# Altium project SISPS-BATT-INT-PCB.PrjPcb (part 1 of 2)
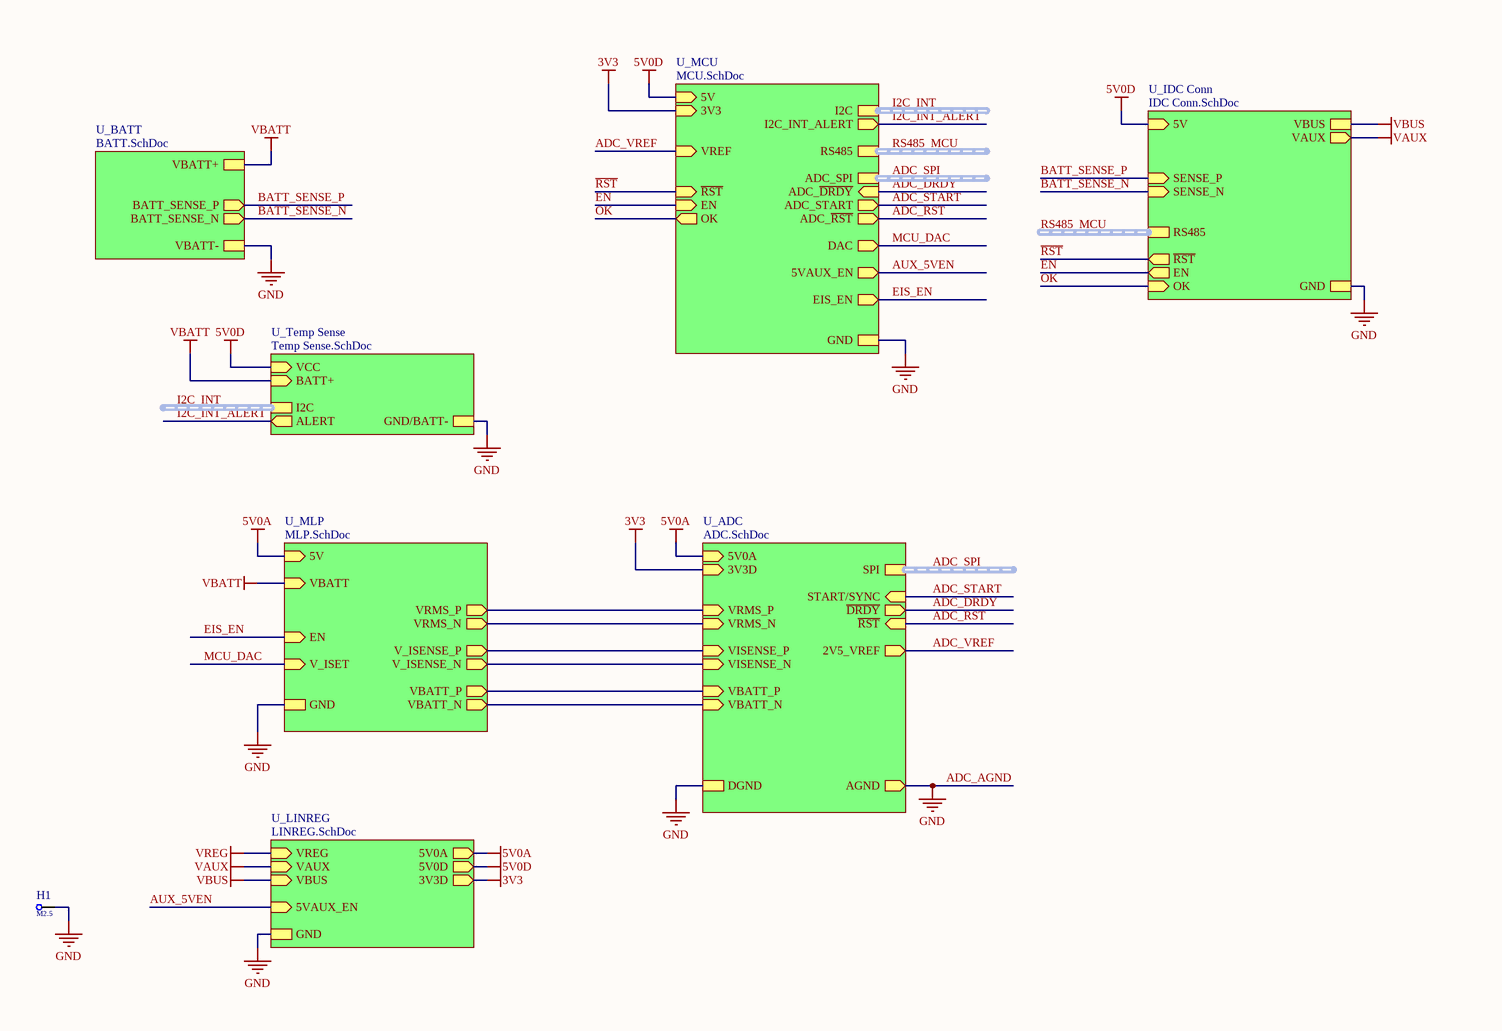
[diagram p0: Main.SchDoc, left]
Approv_Date_Chk: 16/01/2026; Approv_Date_Eng: 24/01/2026; ASM_DOC: Assembley.PCBDwf; BOM_DOC: Bill of Materials.csv; Checker: JC Pead; CopyrightHolder: LD Stanton; CopyrightYear: 2026; CPL_DOC: Pick and Place.csv; DwgTitleLine1: SISPS-BATT-INT-PCB; DwgTitleLine2: Battery Unit Interposer; FAB_DOC: Fabrication.PCBDwf; Licence: CERN OHL v2 S; PCB_DOC: PCB.PcbDoc; Project_Revision: v0.2.1; Rev_Date_1: 30/09/2025; Rev_Date_2: 12/12/2025; Rev_Date_3: 24/01/2026; Rev_Date_4: --/--/----; Rev_Desc_1: EIS Circuitry Prototype; Rev_Desc_2: Faulty Release; Rev_Desc_3: Impedance Measurement Corrections; Rev_Desc_4: - - - - -; Rev_No_1: v0.1; Rev_No_2: v0.2; Rev_No_3: v0.2.1; Rev_No_4: -; SCH_DOC: Main.SchDoc
14 sheets, 192 parts. Net scope: strictly hierarchical (ports join the sheet entries above them; power ports are local).
Board file: PCB.PcbDoc
Sheets:
  Main.SchDoc
    U_Temp Sense = Temp Sense.SchDoc
    U_MCU = MCU.SchDoc
      U_SWD = SWD.SchDoc
      U_RS485 = RS485.SchDoc
    U_IDC Conn = IDC Conn.SchDoc
    U_MLP = MLP.SchDoc
      U_RMS = RMS.SchDoc
      U_EL = EL.SchDoc
      U_VBATT Sense = VBATT Sense.SchDoc
    U_ADC = ADC.SchDoc
      U_ADC AIN = ADC AIN.SchDoc
    U_LINREG = LINREG.SchDoc
    U_BATT = BATT.SchDoc

## Sheet Main.SchDoc: Main Schematic
size A4; ApprovedBy: LD Stanton; Author: LD Stanton; DrawnBy: LD Stanton; Engineer: LD Stanton; Organization: University of Cape Town; Address1: Department of Electrical Engineering; Address2: Menzies Building, Upper Campus; Address3: Cape Town, South Africa; Address4: 7701; DocumentNumber: 1; SheetNumber: 1; SheetTotal: 14; Project_Name: SISPS-BATT Interposer

### Parts
H1  Size: M2.5  [Mounting Hole M2.5 Plated Tight Via]  (hidden comment: Mounting Hole M2.5)  (no BOM)

### Sub-sheets
U_ADC = ADC.SchDoc: SPI (harness SPI), ~{RST} (in), ~{DRDY} (out), 5V0A (in), 3V3D (in), START/SYNC (in), VRMS_P (in), VRMS_N (in), DGND, AGND (out), VISENSE_P (in), VISENSE_N (in), VBATT_P (in), VBATT_N (in), 2V5_VREF (out)
U_BATT = BATT.SchDoc: BATT_SENSE_P (out), BATT_SENSE_N (out), VBATT+, VBATT-
U_IDC Conn = IDC Conn.SchDoc: VAUX (out), VBUS, GND, ~{RST} (out), EN (out), OK (in), SENSE_P (in), SENSE_N (in), 5V (in), RS485 (harness RS485)
U_LINREG = LINREG.SchDoc: VREG (in), VAUX (in), VBUS (in), 5V0A (out), 5V0D (out), 3V3D (out), GND, 5VAUX_EN (in)
U_MCU = MCU.SchDoc: I2C_INT_ALERT (out), 3V3 (in), GND, I2C (harness I2C), ~{RST} (in), ADC_SPI (harness SPI), ADC_~{DRDY} (in), ADC_START (out), ADC_~{RST} (out), VREF (in), DAC (out), RS485 (harness RS485), 5V (in), 5VAUX_EN (out), EN (in), OK (out), EIS_EN (out)
U_MLP = MLP.SchDoc: 5V (in), VBATT (in), GND, VRMS_P (out), VRMS_N (out), V_ISET (in), V_ISENSE_P (out), V_ISENSE_N (out), VBATT_P (out), EN (in), VBATT_N (out)
U_Temp Sense = Temp Sense.SchDoc: I2C (harness I2C), ALERT (out), BATT+ (in), VCC (in), GND/BATT-

### Nets
3V3: sheet U_MCU/3V3, sheet U_ADC/3V3D, sheet U_LINREG/3V3D
5V0A: sheet U_MLP/5V, sheet U_ADC/5V0A, sheet U_LINREG/5V0A
5V0D: sheet U_Temp Sense/VCC, sheet U_MCU/5V, sheet U_IDC Conn/5V, sheet U_LINREG/5V0D
GND: H1.1 ; sheet U_Temp Sense/GND/BATT-, sheet U_MCU/GND, sheet U_IDC Conn/GND, sheet U_MLP/GND, sheet U_ADC/DGND, sheet U_ADC/AGND, sheet U_LINREG/GND, sheet U_BATT/VBATT-  [also labelled ADC_AGND]
VAUX: sheet U_IDC Conn/VAUX, sheet U_LINREG/VAUX
VBATT: sheet U_Temp Sense/BATT+, sheet U_MLP/VBATT, sheet U_BATT/VBATT+
VBUS: sheet U_IDC Conn/VBUS, sheet U_LINREG/VBUS
~{RST}: sheet U_MCU/~{RST}, sheet U_IDC Conn/~{RST}
ADC_~{DRDY}: sheet U_MCU/ADC_~{DRDY}, sheet U_ADC/~{DRDY}
ADC_~{RST}: sheet U_MCU/ADC_~{RST}, sheet U_ADC/~{RST}
ADC_START: sheet U_MCU/ADC_START, sheet U_ADC/START/SYNC
ADC_VREF: sheet U_MCU/VREF, sheet U_ADC/2V5_VREF
AUX_5VEN: sheet U_MCU/5VAUX_EN, sheet U_LINREG/5VAUX_EN
BATT_SENSE_N: sheet U_IDC Conn/SENSE_N, sheet U_BATT/BATT_SENSE_N
BATT_SENSE_P: sheet U_IDC Conn/SENSE_P, sheet U_BATT/BATT_SENSE_P
EIS_EN: sheet U_MCU/EIS_EN, sheet U_MLP/EN
EIS_VBATT_N: sheet U_MLP/VBATT_N, sheet U_ADC/VBATT_N
EIS_VBATT_P: sheet U_MLP/VBATT_P, sheet U_ADC/VBATT_P
EIS_VISENSE_N: sheet U_MLP/V_ISENSE_N, sheet U_ADC/VISENSE_N
EIS_VISENSE_P: sheet U_MLP/V_ISENSE_P, sheet U_ADC/VISENSE_P
EIS_VRMS_N: sheet U_MLP/VRMS_N, sheet U_ADC/VRMS_N
EIS_VRMS_P: sheet U_MLP/VRMS_P, sheet U_ADC/VRMS_P
EN: sheet U_MCU/EN, sheet U_IDC Conn/EN
I2C_INT_ALERT: sheet U_Temp Sense/ALERT, sheet U_MCU/I2C_INT_ALERT
MCU_DAC: sheet U_MCU/DAC, sheet U_MLP/V_ISET
OK: sheet U_MCU/OK, sheet U_IDC Conn/OK

### Buses and harness runs
harness ADC_SPI = sheet U_ADC/SPI
harness ADC_SPI = sheet U_MCU/ADC_SPI
harness I2C_INT = sheet U_MCU/I2C
harness I2C_INT = sheet U_Temp Sense/I2C
harness RS485_MCU = sheet U_IDC Conn/RS485
harness RS485_MCU = sheet U_MCU/RS485

### Notes on the sheet
- © =CopyrightHolder =CopyrightYear
- This project and information contained within is the copyright property of the author. All rights are reserved. No warranty is given. No liability is assumed. Confidential unless licenced.
- Licence:
- Engineer:
- Checker:
- Approvals
- Date
- PCB Doc:
- ASM Doc:
- FAB Doc:
- CPL Doc:
- Reference Documents
- Size:
- Date:
- A4
- Number:
- Time:
- Revision:
- Sheet
- of
- BOM Doc:
- File:
- Author:

### Library data of the parts
H1 = CMP-00028-00005-3: M2.5 Mounting Hole

## Sheet Temp Sense.SchDoc: Temperature Sensor
size A4; ApprovedBy: LD Stanton; Author: LD Stanton; CompanyName: University of Cape Town; DrawnBy: Lawrence Stanton; Engineer: Lawrence Stanton; Organization: University of Cape Town; Address1: Department of Electrical Engineering; Address2: Rondebosch; Address3: Cape Town; Address4: South Africa 7701; DocumentNumber: 14; SheetNumber: 14; SheetTotal: 14
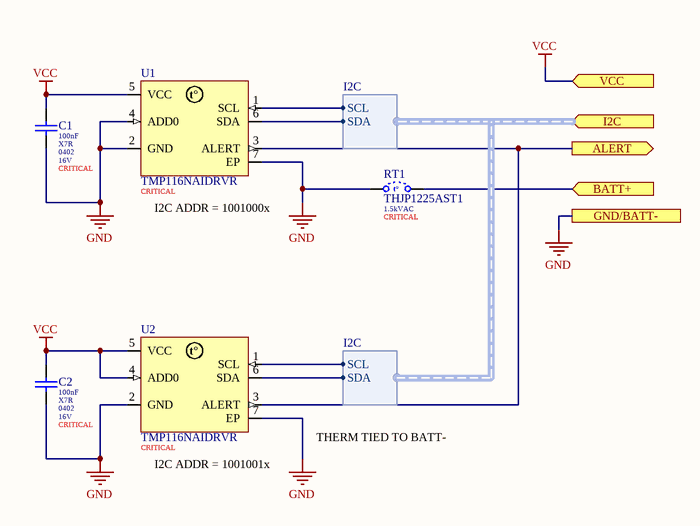
[diagram p1: Temp Sense.SchDoc]

### Parts
C1  value 100nF  Dielectric: X7R  Package: 0402  Voltage: 16V  Populate: CRITICAL  [0402_050_5 (Samsumg) B]  (hidden comment: CL05B104KO5NNNC)
C2  value 100nF  Dielectric: X7R  Package: 0402  Voltage: 16V  Populate: CRITICAL  [0402_050_5 (Samsumg) B]  (hidden comment: CL05B104KO5NNNC)
RT1  THJP1225AST1  Voltage: 1.5kVAC  Placement: CRITICAL  [RESC3264X09N B]
U1  TMP116NAIDRVR  Placement: CRITICAL  [SON (DRV006B) EP B]
U2  TMP116NAIDRVR  Placement: CRITICAL  [SON (DRV006B) EP B]

### Ports
ALERT (out), BATT+ (in), GND/BATT-, I2C (in, harness I2C), VCC (in)

### Harnesses
I2C: SCL, SDA

### Nets
GND: C1.2 C2.2 RT1.1 U1.2(GND) U1.4(ADD0) U1.7(EP) U2.2(GND) U2.7(EP) ; port GND/BATT-
VBATT: RT1.2 ; port BATT+
VCC: C1.1 C2.1 U1.5(VCC) U2.4(ADD0) U2.5(VCC) ; port VCC  [project net 5V0D]
I2C_INT.SCL: U1.1(SCL) U2.1(SCL) ; port I2C.SCL
I2C_INT.SDA: U1.6(SDA) U2.6(SDA) ; port I2C.SDA
I2C_INT_ALERT: U1.3(ALERT) U2.3(ALERT) ; port ALERT

### Notes on the sheet
- (near U1) I2C ADDR = 1001000x
- THERM TIED TO BATT-
- (near U2) I2C ADDR = 1001001x
- Size:
- Date:
- A4
- Number:
- Time:
- Revision:
- Sheet
- of
- File:
- Author:
- (in symbol CMP-061-000004-3) t°
- (in symbol CMP-00120-2) t°

### Library data of the parts
C1 C2 = CMP-045-000014-12: MLCC 100nF 0402 16V X7R ±10%; Manufacturer: Samsung; ComponentLink1Description: Datasheet; ComponentLink1URL: https://datasheet.lcsc.com/szlcsc/Samsung-Electro-Mechanics-CL05C100JB5NNNC_C32949.pdf; LCSC Part Number: C1525; Tolerance: ±10%
RT1 = CMP-00120-2: Thermal Jumper 1225 259mW/K 1.5kVAC; LCSC Part Number: C22414428
U1 U2 = CMP-061-000004-3: Digital Temperature Sensor ±0.2°C NV Memory 6-WSON -55 to 125°C; Manufacturer: Texas Instruments; Interface: I2C,SMBus,2-Wire; Resolution: 16b; LCSC Part Number: C182074; ComponentLink1URL: https://www.ti.com/lit/ds/symlink/tmp116.pdf?ts=1635336236311&ref_url=https%253A%252F%252Fwww.google.com%252F; ComponentLink1Description: Datasheet; Max Operating Temperature: 150°C; Package: SON-6; Min Operating Temperature: -55°C

## Sheet MCU.SchDoc: Microcontroller
size A4; ApprovedBy: LD Stanton; Author: LD Stanton; CompanyName: University of Cape Town; DrawnBy: Lawrence Stanton; Engineer: Lawrence Stanton; Organization: University of Cape Town; Address1: Department of Electrical Engineering; Address2: Rondebosch; Address3: Cape Town; Address4: South Africa 7701; DocumentNumber: 5; SheetNumber: 5; SheetTotal: 14
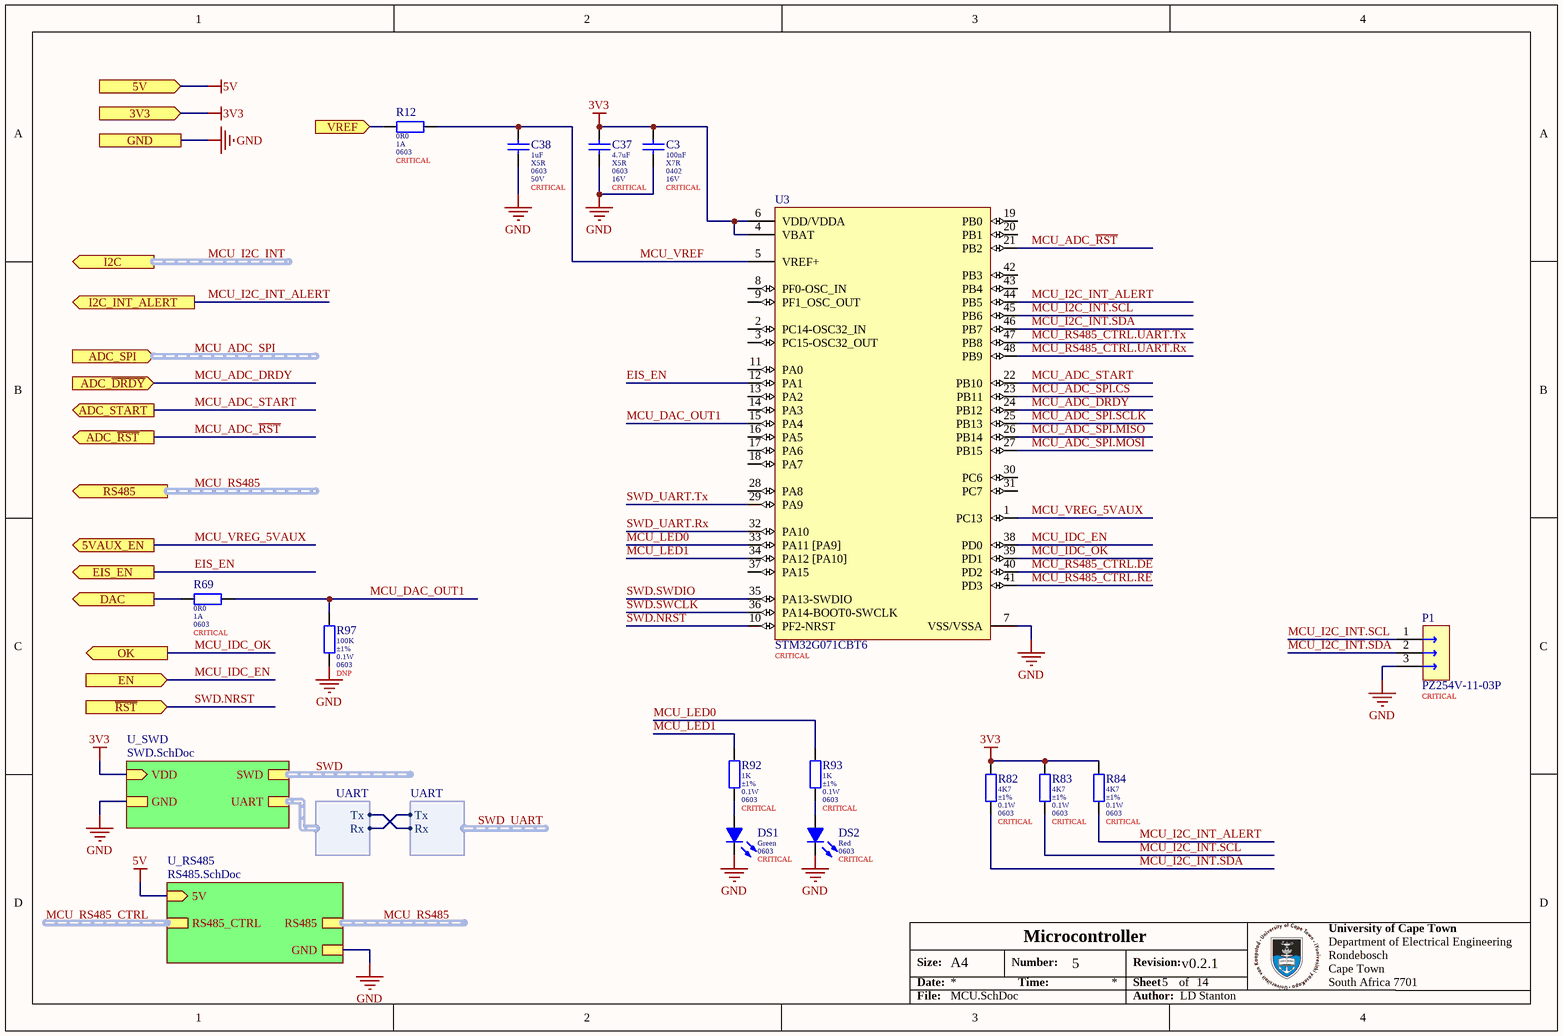
[diagram p2: MCU.SchDoc]

### Parts
C3  value 100nF  Dielectric: X7R  Package: 0402  Voltage: 16V  Populate: CRITICAL  [0402_050_5 (Samsumg) B]  (hidden comment: CL05B104KO5NNNC)
C37  value 4.7uF  Dielectric: X5R  Package: 0603  Voltage: 16V  Populate: CRITICAL  [0603_080_8 (Samsung) B]  (hidden comment: CL10A475KO8NNNC)
C38  value 1uF  Dielectric: X5R  Package: 0603  Voltage: 50V  Populate: CRITICAL  [0603_080_8 (Samsung) B]  (hidden comment: CL10A105KB8NNNC)
DS1  Colour: Green  Package: 0603  Placement: CRITICAL  [LED 0603 (Everlight) B]  (hidden comment: 19-217/GHC-YR1S2/6T)
DS2  Colour: Red  Package: 0603  Placement: CRITICAL  [LED 0603 (Hubei) B]  (hidden comment: KT-0603R)
P1  PZ254V-11-03P  Placement: CRITICAL  [Pin Header 3 1 Male Vertical]
R12  value 0R0  Current: 1A  Package: 0603  Populate: CRITICAL  [0603 (Uniroyal) B]  (hidden comment: 0603WAF0000T5E)
R69  value 0R0  Current: 1A  Package: 0603  Populate: CRITICAL  [0603 (Uniroyal) B]  (hidden comment: 0603WAF0000T5E)
R82  value 4K7  Tolerance: ±1%  Power: 0.1W  Package: 0603  Populate: CRITICAL  [0603 (Uniroyal) B]  (hidden comment: 0603WAF4701T5E)
R83  value 4K7  Tolerance: ±1%  Power: 0.1W  Package: 0603  Populate: CRITICAL  [0603 (Uniroyal) B]  (hidden comment: 0603WAF4701T5E)
R84  value 4K7  Tolerance: ±1%  Power: 0.1W  Package: 0603  Populate: CRITICAL  [0603 (Uniroyal) B]  (hidden comment: 0603WAF4701T5E)
R92  value 1K  Tolerance: ±1%  Power: 0.1W  Package: 0603  Populate: CRITICAL  [0603 (Uniroyal) B]  (hidden comment: 0603WAF1001T5E)
R93  value 1K  Tolerance: ±1%  Power: 0.1W  Package: 0603  Populate: CRITICAL  [0603 (Uniroyal) B]  (hidden comment: 0603WAF1001T5E)
R97  value 100K  Tolerance: ±1%  Power: 0.1W  Package: 0603  Populate: DNP  [0603 (Uniroyal) B]  (hidden comment: 0603WAF1003T5E)
U3  STM32G071CBT6  Placement: CRITICAL  [LQFP48 (STM32G0) B]

### Sub-sheets
U_RS485 = RS485.SchDoc: RS485 (harness RS485), RS485_CTRL (harness RS485_CTRL), 5V (in), GND
U_SWD = SWD.SchDoc: SWD (harness SWD), UART (harness UART), VDD (in), GND

### Ports
3V3 (in), 5V (in), 5VAUX_EN (out), ADC_SPI (in, harness SPI), ADC_START (out), ADC_~{DRDY} (in), ADC_~{RST} (out), DAC (out), EIS_EN (out), EN (in), GND, I2C (out, harness I2C), I2C_INT_ALERT (out), OK (out), RS485 (out, harness RS485), VREF (in), ~{RST} (in)

### Harnesses
UART: Tx, Rx

### Nets
3V3: C3.1 C37.1 R82.1 R83.1 R84.1 U3.4(VBAT) U3.6(VDD/VDDA) ; port 3V3, sheet U_SWD/VDD
5V: port 5V, sheet U_RS485/5V  [project net 5V0D]
GND: C3.2 C37.2 C38.2 DS1.K DS2.K P1.3 R97.2 U3.7(VSS/VSSA) ; port GND, sheet U_SWD/GND, sheet U_RS485/GND
ADC_VREF: R12.1 ; port VREF
EIS_EN: U3.12(PA1) ; port EIS_EN
MCU_ADC_DRDY: U3.24(PB12) ; port ADC_~{DRDY}  [project net ADC_~{DRDY}]
MCU_ADC_~{RST}: U3.21(PB2) ; port ADC_~{RST}  [project net ADC_~{RST}]
MCU_ADC_SPI~{.}CS: U3.23(PB11)
MCU_ADC_SPI.MISO: U3.26(PB14)
MCU_ADC_SPI.MOSI: U3.27(PB15)
MCU_ADC_SPI.SCLK: U3.25(PB13)
MCU_ADC_START: U3.22(PB10) ; port ADC_START  [project net ADC_START]
MCU_DAC: R69.1 ; port DAC
MCU_DAC_OUT1: R69.2 R97.1 U3.15(PA4)
MCU_I2C_INT.SCL: P1.1 R83.2 U3.45(PB6)
MCU_I2C_INT.SDA: P1.2 R82.2 U3.46(PB7)
MCU_I2C_INT_ALERT: R84.2 U3.44(PB5) ; port I2C_INT_ALERT  [project net I2C_INT_ALERT]
MCU_IDC_EN: U3.38(PD0) ; port EN  [project net EN]
MCU_IDC_OK: U3.39(PD1) ; port OK  [project net OK]
MCU_LED0: R93.1 U3.33(PA11_[PA9])
MCU_LED1: R92.1 U3.34(PA12_[PA10])
MCU_RS485_CTRL.DE: U3.40(PD2)
MCU_RS485_CTRL.~{RE}: U3.41(PD3)
MCU_RS485_CTRL.UART.Rx: U3.48(PB9)
MCU_RS485_CTRL.UART.Tx: U3.47(PB8)
MCU_VREF: C38.1 R12.2 U3.5(VREF+)
MCU_VREG_5VAUX: U3.1(PC13) ; port 5VAUX_EN  [project net AUX_5VEN]
SWD.NRST: U3.10(PF2-NRST) ; port ~{RST}  [project net ~{RST}]
SWD.SWCLK: U3.36(PA14-BOOT0-SWCLK)
SWD.SWDIO: U3.35(PA13-SWDIO)
SWD_UART.Rx: U3.32(PA10)
SWD_UART.Rx: sheet U_SWD/UART.Tx, harness UART.Rx  [a separate net that carries the same name]
SWD_UART.Tx: U3.29(PA9)
SWD_UART.Tx: sheet U_SWD/UART.Rx, harness UART.Tx  [a separate net that carries the same name]
NetDS1_A: DS1.A R92.2
NetDS2_A: DS2.A R93.2

Not connected (* = marked no-connect by the designer): U3 2(PC14-OSC32_IN) 3(PC15-OSC32_OUT) 8(PF0-OSC_IN) 9(PF1_OSC_OUT) 11(PA0) 13(PA2) 14(PA3) 16(PA5) 17(PA6) 18(PA7) 19(PB0) 20(PB1) 28(PA8) 30(PC6) 31(PC7) 37(PA15) 42(PB3) 43(PB4)

### Buses and harness runs
harness MCU_ADC_SPI = port ADC_SPI
harness MCU_I2C_INT = port I2C
harness MCU_RS485 = port RS485
harness MCU_RS485 = sheet U_RS485/RS485
harness MCU_RS485_CTRL = sheet U_RS485/RS485_CTRL
harness SWD = sheet U_SWD/SWD

### Notes on the sheet
- Size:
- Date:
- A4
- Number:
- Time:
- Revision:
- Sheet
- of
- File:
- Author:

### Library data of the parts
C3 = CMP-045-000014-12: as C1 on sheet Temp Sense; ComponentLink1Description: Datasheet; ComponentLink1URL: https://datasheet.lcsc.com/szlcsc/Samsung-Electro-Mechanics-CL05C100JB5NNNC_C32949.pdf; LCSC Part Number: C1525; Tolerance: ±10%
C37 = CMP-014-000007-7: MLCC 4.7uF 0603 16V X5R ±10%; Manufacturer: Samsung; ComponentLink1Description: Datasheet; ComponentLink1URL: https://datasheet.lcsc.com/szlcsc/Samsung-Electro-Mechanics-CL05C100JB5NNNC_C32949.pdf; LCSC Part Number: C19666; Tolerance: ±10%
C38 = CMP-045-000002-11: MLCC 1uF 0603 50V X5R ±10%; Manufacturer: Samsung; ComponentLink1URL: https://datasheet.lcsc.com/szlcsc/Samsung-Electro-Mechanics-CL05C100JB5NNNC_C32949.pdf; ComponentLink1Description: Datasheet; Tolerance: ±10%; LCSC Part Number: C15849
DS1 = CMP-007-00001-1: LED 0603 SMT Green; Manufacturer: Everlight; Maximum Forward Current: 25mA; Nominal Forward Voltage: 3V3; ComponentLink1Description: Datasheet; LCSC Part Number: C2986059; ComponentLink1URL: https://datasheet.lcsc.com/szlcsc/Everlight-Elec-19-217-GHC-YR1S2-3T_C72043.pdf
DS2 = CMP-035-000001-5: LED 0603 SMT Red; Manufacturer: Hubei; Maximum Forward Current: 20mA; Nominal Forward Voltage: 2V0; ComponentLink1URL: https://datasheet.lcsc.com/szlcsc/Hubei-KENTO-Elec-KT-0603R_C2286.pdf; LCSC Part Number: C2286; ComponentLink1Description: Datasheet
P1 = CMP-00149-2: Pin Header 3 1 Vertical Male; LCSC Part Number: C2937625; ComponentLink1URL: https://jlcpcb.com/api/file/downloadByFileSystemAccessId/8588954567287443456; ComponentLink1Description: Datasheet
R12 R69 = CMP-010-000359-7: Jumper 0603 1A Uniroyal; Pin Count: 2; ComponentLink1URL: https://datasheet.lcsc.com/szlcsc/1811062009_UNI-ROYAL-Uniroyal-Elec-0603WAF1002T5E_C25804.pdf; Manufacturer: Uniroyal; LCSC Part Number: C21189; Temperature: -55 - 155°C; ComponentLink1Description: Datasheet
R82-R84 = CMP-010-000405-2: Resistor 4K7 0603 ±1% Thick Film Uniroyal; Temperature Coefficient: ±100ppm/K; Working Voltage: 75V; Manufacturer: Uniroyal; ComponentLink1Description: Datasheet; Temperature: -55 - 155°C; ComponentLink1URL: https://datasheet.lcsc.com/szlcsc/1811062009_UNI-ROYAL-Uniroyal-Elec-0603WAF1002T5E_C25804.pdf; LCSC Part Number: C23162
R92 R93 = CMP-010-000308-11: Resistor 1K0 0603 ±1% Thick Film Uniroyal; Working Voltage: 75V; Temperature Coefficient: ±100ppm/K; LCSC Part Number: C21190; ComponentLink1URL: https://datasheet.lcsc.com/szlcsc/1811062009_UNI-ROYAL-Uniroyal-Elec-0603WAF1002T5E_C25804.pdf; Manufacturer: Uniroyal; Pin Count: 2; Temperature: -55 - 155°C; ComponentLink1Description: Datasheet
R97 = CMP-010-000288-10: Resistor 100K 0603 ±1% Thick Film Uniroyal; Temperature Coefficient: ±100ppm/K; Working Voltage: 75V; LCSC Part Number: C25803; Temperature: -55 - 155°C; ComponentLink1URL: https://datasheet.lcsc.com/szlcsc/1811062009_UNI-ROYAL-Uniroyal-Elec-0603WAF1002T5E_C25804.pdf; Pin Count: 2; Manufacturer: Uniroyal; ComponentLink1Description: Datasheet
U3 = CMP-00139-1: MCU 32-bit ARM Cortex M0+ RISC 128KB Flash 1.8V/2.5V/3.3V 48-Pin LQFP Tray; ComponentLink1URL: https://www.st.com/en/microcontrollers-microprocessors/stm32g071cb.html#documentation; ComponentLink2URL: https://www.st.com/resource/en/datasheet/stm32g071cb.pdf; ComponentLink3URL: https://www.st.com/resource/en/application_note/an5096-getting-started-with-stm32g0-series-hardware-development-stmicroelectronics.pdf; Min Operating Temperature: -40°C; Max Operating Temperature: 85°C; ComponentLink2Description: Datasheet; ComponentLink3Description: Hardware Development; ComponentLink1Description: Product Page; LCSC Part Number: C432212

## Sheet SWD.SchDoc: Serial Wire Debug
size A4; ApprovedBy: LD Stanton; Author: LD Stanton; CompanyName: University of Cape Town; DrawnBy: Lawrence Stanton; Engineer: Lawrence Stanton; Organization: University of Cape Town; Address1: Department of Electrical Engineering; Address2: Rondebosch; Address3: Cape Town; Address4: South Africa 7701; DocumentNumber: 6; SheetNumber: 6; SheetTotal: 14
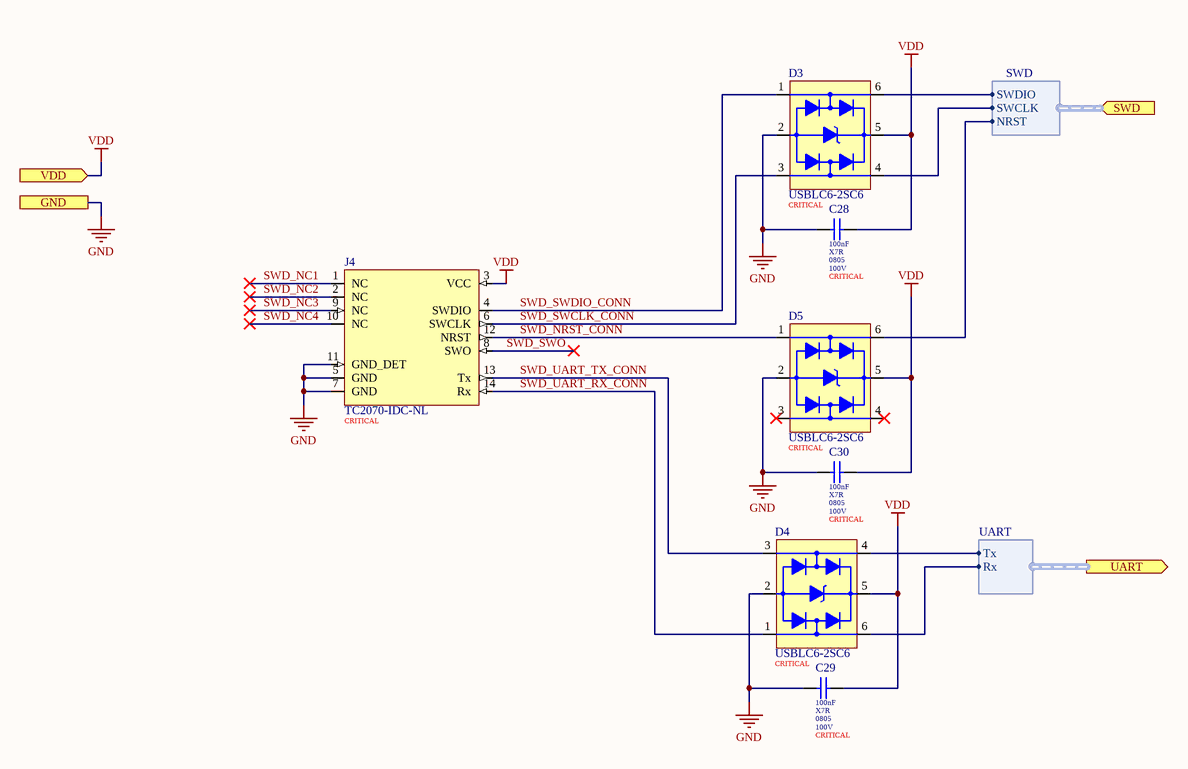
[diagram p3: SWD.SchDoc]

### Parts
C28  value 100nF  Dielectric: X7R  Package: 0805  Voltage: 100V  Populate: CRITICAL  [0805_125_F (Samsumg) B]  (hidden comment: CL21B104KCFNNNE)
C29  value 100nF  Dielectric: X7R  Package: 0805  Voltage: 100V  Populate: CRITICAL  [0805_125_F (Samsumg) B]  (hidden comment: CL21B104KCFNNNE)
C30  value 100nF  Dielectric: X7R  Package: 0805  Voltage: 100V  Populate: CRITICAL  [0805_125_F (Samsumg) B]  (hidden comment: CL21B104KCFNNNE)
D3  USBLC6-2SC6  Placement: CRITICAL  [SOT-23-6 (USBLC6-2SC6 ST) B]
D4  USBLC6-2SC6  Placement: CRITICAL  [SOT-23-6 (USBLC6-2SC6 ST) B]
D5  USBLC6-2SC6  Placement: CRITICAL  [SOT-23-6 (USBLC6-2SC6 ST) B]
J4  TC2070-IDC-NL  Placement: CRITICAL  [TC2070 NL]  (no BOM)

### Ports
GND, SWD (in, harness SWD), UART (out, harness UART), VDD (in)

### Harnesses
SWD: SWDIO, SWCLK, NRST
UART: Tx, Rx

### Nets
GND: C28.1 C29.1 C30.1 D3.2(GND) D4.2(GND) D5.2(GND) J4.5(GND) J4.7(GND) J4.11(GND_DET) ; port GND
VDD: C28.2 C29.2 C30.2 D3.5(VBUS) D4.5(VBUS) D5.5(VBUS) J4.3(VCC) ; port VDD  [project net 3V3]
SWD.NRST: D5.6(I/O_4) ; port SWD.NRST
SWD.SWCLK: D3.4(I/O_3) ; port SWD.SWCLK
SWD.SWDIO: D3.6(I/O_4) ; port SWD.SWDIO
SWD_NC1: J4.1(NC)
SWD_NC2: J4.2(NC)
SWD_NC3: J4.9(NC)
SWD_NC4: J4.10(NC)
SWD_NRST_CONN: D5.1(I/O_1) J4.12(NRST)
SWD_SWCLK_CONN: D3.3(I/O_2) J4.6(SWCLK)
SWD_SWDIO_CONN: D3.1(I/O_1) J4.4(SWDIO)
SWD_SWO: J4.8(SWO)
SWD_UART.Rx: D4.4(I/O_3) ; port UART.Tx
SWD_UART.Tx: D4.6(I/O_4) ; port UART.Rx
SWD_UART_RX_CONN: D4.1(I/O_1) J4.14(Rx)
SWD_UART_TX_CONN: D4.3(I/O_2) J4.13(Tx)

Not connected (* = marked no-connect by the designer): D5 3(I/O_2)* 4(I/O_3)*

### Notes on the sheet
- Size:
- Date:
- A4
- Number:
- Time:
- Revision:
- Sheet
- of
- File:
- Author:

### Library data of the parts
C28-C30 = CMP-00100-3: MLCC 100nF 0805 100V X7R ±10%; Manufacturer: Samsung; ComponentLink1URL: https://datasheet.lcsc.com/szlcsc/Samsung-Electro-Mechanics-CL05C100JB5NNNC_C32949.pdf; LCSC Part Number: C28233; ComponentLink1Description: Datasheet; Tolerance: ±10%
D3-D5 = CMP-000039-5: TVS Diode Array Low Capacitance SOT23-6; Manufacturer: ST Microelectronics; Peak Pulse Current: 5A; Data Rate: 480Mbps; Breakdown Voltage: 6V; Leakage Current: 150nA; Clamping Voltage: 17V; Capacitance: 3.5pF; RoHS Compliant: Yes; Min Operating Temperature: -40°C; ComponentLink1URL: https://www.st.com/resource/en/datasheet/usblc6-2.pdf; Case/Package: SOT-23-6; LCSC Part Number: C7519; ComponentLink1Description: Datasheet; Max Operating Temperature: 125°C
J4 = CMP-00121-2: 14-Pin Plug-of-nails connector for SWD Footprint; ComponentLink2URL: https://www.tag-connect.com/product/tc2070-idc-nl-050; ComponentLink2Description: Product Page; ComponentLink1URL: https://www.tag-connect.com/wp-content/uploads/bsk-pdf-manager/TC2070-IDC-NL_Datasheet_12.pdf; ComponentLink1Description: Datasheet

## Sheet RS485.SchDoc: RS485 Transceiver
size A4; ApprovedBy: LD Stanton; Author: LD Stanton; CompanyName: University of Cape Town; DrawnBy: Lawrence Stanton; Engineer: Lawrence Stanton; Organization: University of Cape Town; Address1: Department of Electrical Engineering; Address2: Rondebosch; Address3: Cape Town; Address4: South Africa 7701; DocumentNumber: 7; SheetNumber: 7; SheetTotal: 14
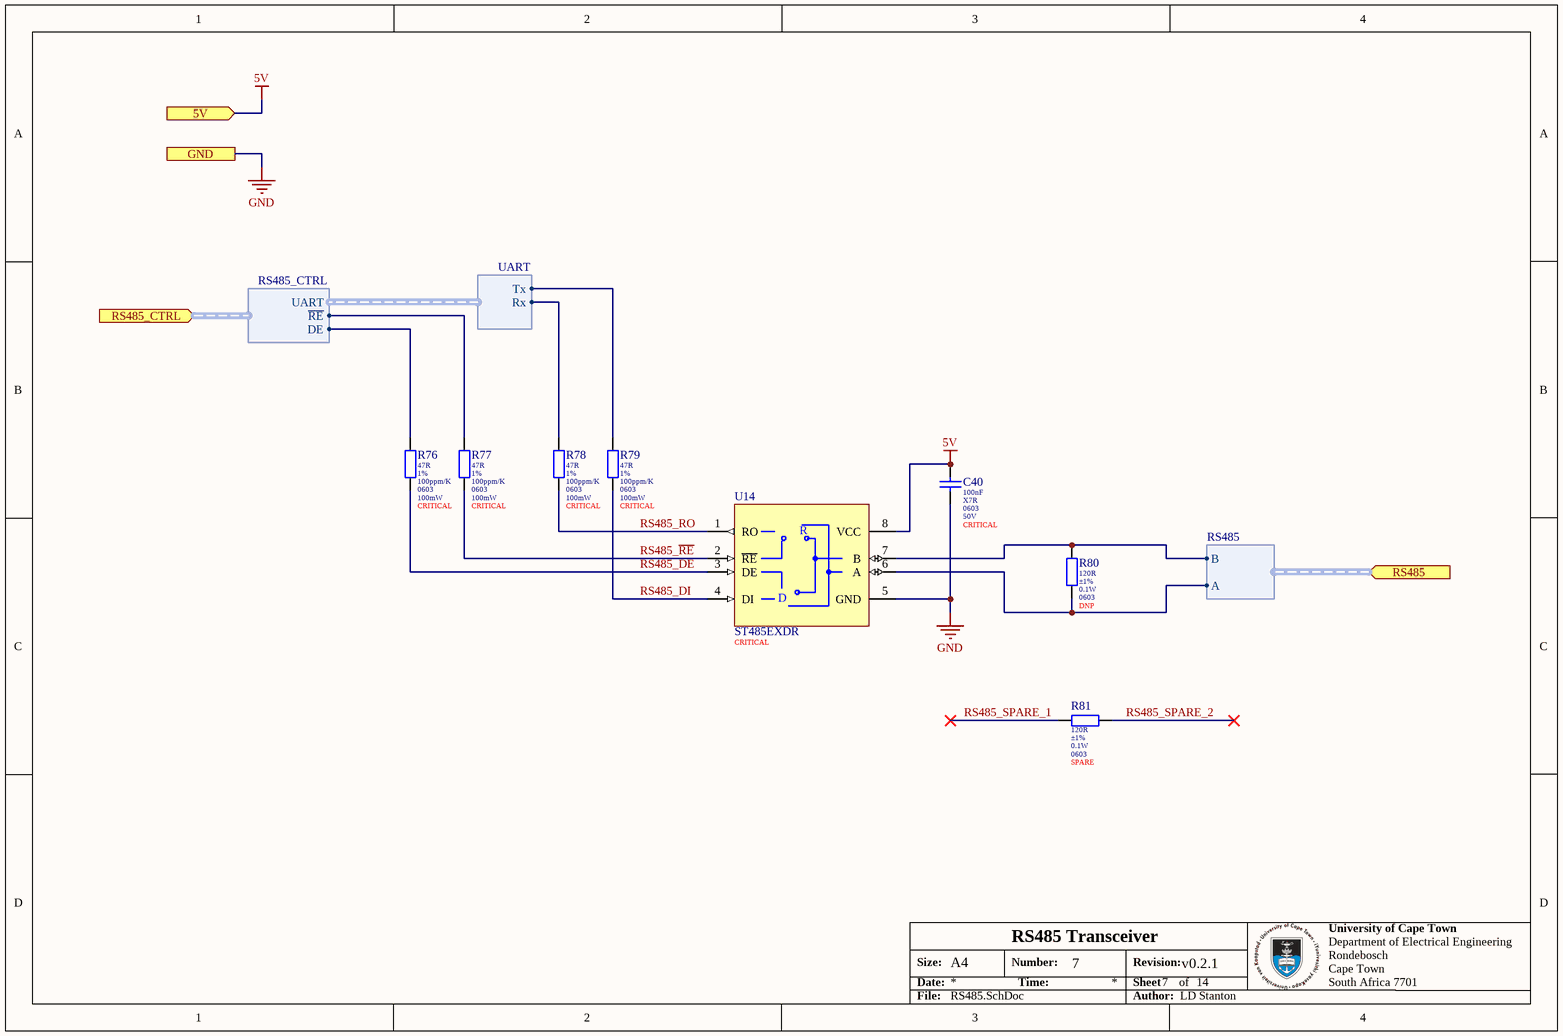
[diagram p4: RS485.SchDoc]

### Parts
C40  value 100nF  Dielectric: X7R  Package: 0603  Voltage: 50V  Populate: CRITICAL  [0603 (Yageo DA) B]  (hidden comment: CC0603KRX7R9BB104)
R76  value 47R  Tolerance: 1%  Temperature Coefficient: 100ppm/K  Package: 0603  Power: 100mW  Populate: CRITICAL  [0603 (Uniroyal) B]  (hidden comment: 0603WAF470JT5E)
R77  value 47R  Tolerance: 1%  Temperature Coefficient: 100ppm/K  Package: 0603  Power: 100mW  Populate: CRITICAL  [0603 (Uniroyal) B]  (hidden comment: 0603WAF470JT5E)
R78  value 47R  Tolerance: 1%  Temperature Coefficient: 100ppm/K  Package: 0603  Power: 100mW  Populate: CRITICAL  [0603 (Uniroyal) B]  (hidden comment: 0603WAF470JT5E)
R79  value 47R  Tolerance: 1%  Temperature Coefficient: 100ppm/K  Package: 0603  Power: 100mW  Populate: CRITICAL  [0603 (Uniroyal) B]  (hidden comment: 0603WAF470JT5E)
R80  value 120R  Tolerance: ±1%  Power: 0.1W  Package: 0603  Populate: DNP  [0603 (Uniroyal) B]  (hidden comment: 0603WAF1200T5E)
R81  value 120R  Tolerance: ±1%  Power: 0.1W  Package: 0603  Populate: SPARE  [0603 (Uniroyal) B]  (hidden comment: 0603WAF1200T5E)
U14  ST485EXDR  Placement: CRITICAL  [SO-8 (ST485E) B]

### Ports
5V (in), GND, RS485 (in, harness RS485), RS485_CTRL (in, harness RS485_CTRL)

### Harnesses
RS485: A, B
RS485_CTRL: UART, DE, ~{RE}
UART: Tx, Rx

### Nets
5V: C40.1 U14.8(VCC) ; port 5V  [project net 5V0D]
GND: C40.2 U14.5(GND) ; port GND
IDC_RS485.A: R80.2 U14.6(A) ; port RS485.A
IDC_RS485.B: R80.1 U14.7(B) ; port RS485.B
MCU_RS485_CTRL.DE: R76.2 ; port RS485_CTRL.DE
MCU_RS485_CTRL.~{RE}: R77.2 ; port RS485_CTRL.~{RE}
RS485_DE: R76.1 U14.3(DE)
RS485_DI: R79.1 U14.4(DI)
RS485_~{RE}: R77.1 U14.2(~{RE})
RS485_RO: R78.1 U14.1(RO)
RS485_SPARE_1: R81.1
RS485_SPARE_2: R81.2
NetR78_2: R78.2 ; harness UART.Rx
NetR79_2: R79.2 ; harness UART.Tx

### Notes on the sheet
- Size:
- Date:
- A4
- Number:
- Time:
- Revision:
- Sheet
- of
- File:
- Author:
- (in symbol CMP-00141-1) R; D

### Library data of the parts
C40 = CMP-047-000000-9: MLCC 100nF 50V 0603 X7R ±10%; Manufacturer: Yageo; Tolerance: ±10%; ComponentLink1Description: Datasheet; ComponentLink1URL: https://datasheet.lcsc.com/szlcsc/YAGEO-CC0603KRX7R9BB104_C14663.pdf; LCSC Part Number: C14663
R76-R79 = CMP-00128-3: Resistor 47R 0603 ±1% Thick Film Uniroyal; Voltage Rating: 75V; ComponentLink1Description: Datasheet; Min Operating Temperature: -55°C; Manufacturer: Uniroyal; ComponentLink1URL: https://datasheet.lcsc.com/szlcsc/1811062009_UNI-ROYAL-Uniroyal-Elec-0603WAF1002T5E_C25804.pdf; Composition: Thick Film; LCSC Part Number: C23182; Max Operating Temperature: 155°C
R80 R81 = CMP-010-000300-9: Resistor 120R 0603 ±1% Thick Film Uniroyal; Working Voltage: 75V; Temperature Coefficient: ±100ppm/K; ComponentLink1URL: https://datasheet.lcsc.com/szlcsc/1811062009_UNI-ROYAL-Uniroyal-Elec-0603WAF1002T5E_C25804.pdf; Manufacturer: Uniroyal; LCSC Part Number: C22787; Pin Count: 2; ComponentLink1Description: Datasheet; Temperature: -55 - 155°C
U14 = CMP-00141-1: +/-15 kV ESD protected, low power RS-485/RS-422 transceiver, [-55oC, 125oC] temperature range; ComponentLink1URL: https://www.st.com/resource/en/datasheet/st485ex.pdf; Min Operating Temperature: -55°C; ComponentLink1Description: Datasheet; LCSC Part Number: C283496; Max Operating Temperature: 125°C

## Sheet IDC Conn.SchDoc: Top Panel IDC Connector
size A4; ApprovedBy: LD Stanton; Author: LD Stanton; CompanyName: University of Cape Town; DrawnBy: Lawrence Stanton; Engineer: Lawrence Stanton; Organization: University of Cape Town; Address1: Department of Electrical Engineering; Address2: Rondebosch; Address3: Cape Town; Address4: South Africa 7701; DocumentNumber: 3; SheetNumber: 3; SheetTotal: 14
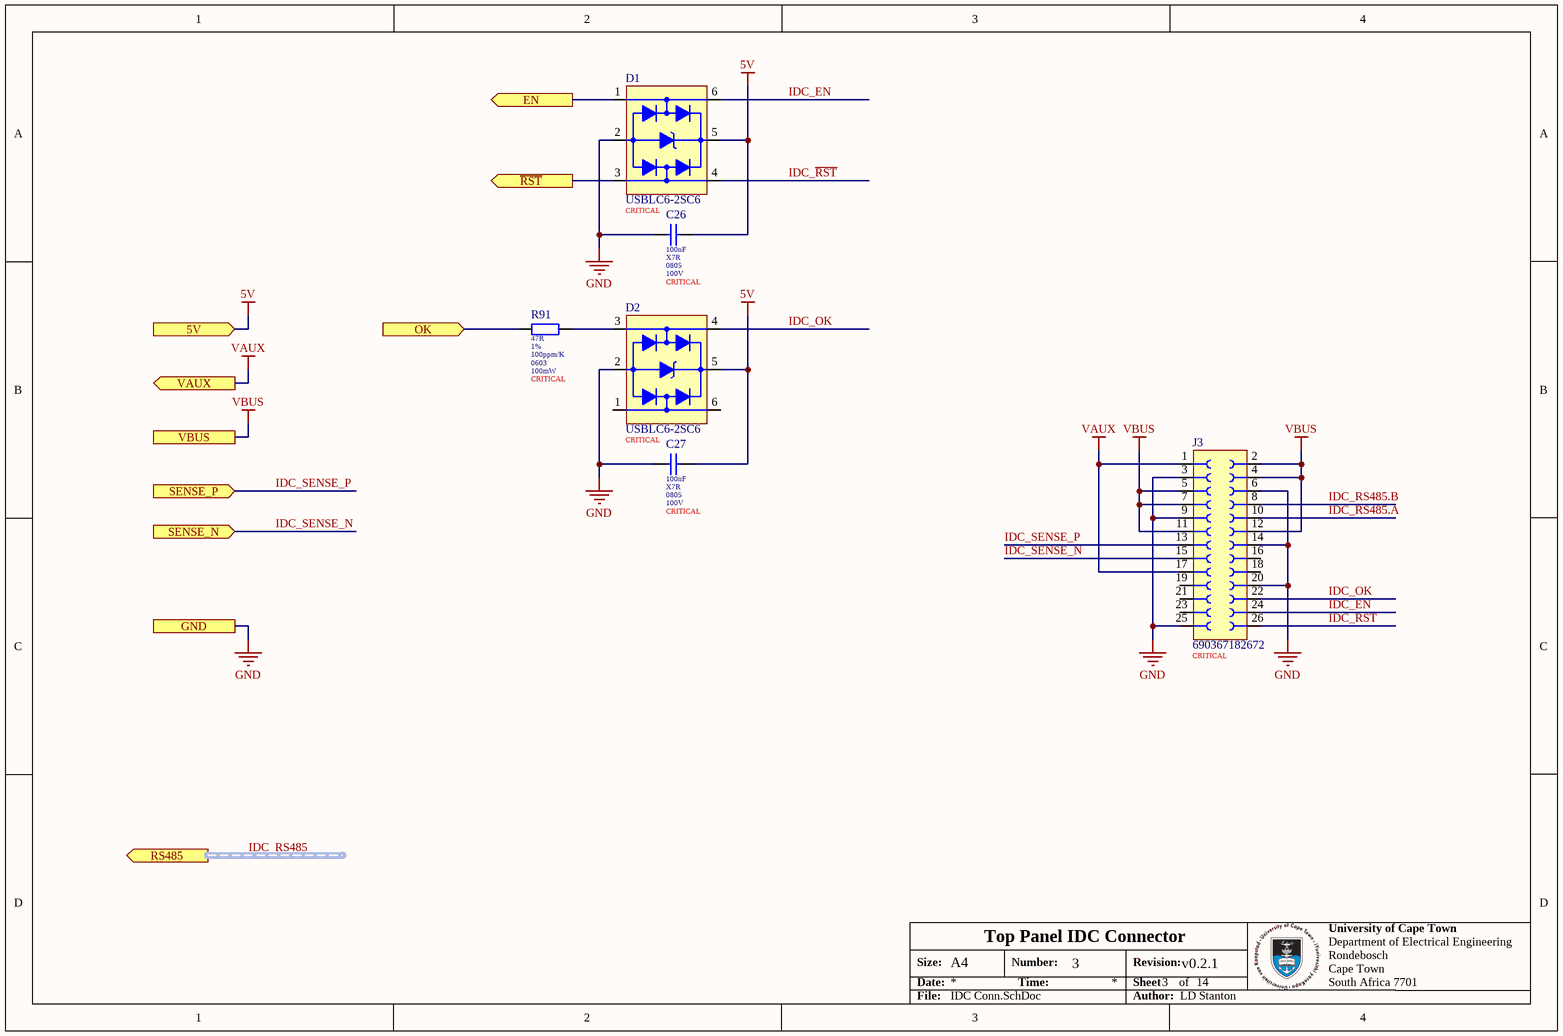
[diagram p5: IDC Conn.SchDoc]

### Parts
C26  value 100nF  Dielectric: X7R  Package: 0805  Voltage: 100V  Populate: CRITICAL  [0805_125_F (Samsumg) B]  (hidden comment: CL21B104KCFNNNE)
C27  value 100nF  Dielectric: X7R  Package: 0805  Voltage: 100V  Populate: CRITICAL  [0805_125_F (Samsumg) B]  (hidden comment: CL21B104KCFNNNE)
D1  USBLC6-2SC6  Placement: CRITICAL  [SOT-23-6 (USBLC6-2SC6 ST) B]
D2  USBLC6-2SC6  Placement: CRITICAL  [SOT-23-6 (USBLC6-2SC6 ST) B]
J3  690367182672  Placement: CRITICAL  [690367182672]
R91  value 47R  Tolerance: 1%  Temperature Coefficient: 100ppm/K  Package: 0603  Power: 100mW  Populate: CRITICAL  [0603 (Uniroyal) B]  (hidden comment: 0603WAF470JT5E)

### Ports
5V (in), EN (out), GND, OK (in), RS485 (out, harness RS485), SENSE_N (in), SENSE_P (in), VAUX (out), VBUS, ~{RST} (out)

### Nets
5V: C26.2 C27.2 D1.5(VBUS) D2.5(VBUS) ; port 5V  [project net 5V0D]
GND: C26.1 C27.1 D1.2(GND) D2.2(GND) J3.3 J3.6 J3.9 J3.14 J3.20 J3.25 ; port GND
VAUX: J3.1 J3.17 ; port VAUX
VBUS: J3.2 J3.4 J3.5 J3.7 J3.11 J3.12 ; port VBUS
~{RST}: D1.3(I/O_2) ; port ~{RST}
EN: D1.1(I/O_1) ; port EN
IDC_EN: D1.6(I/O_4) J3.24
IDC_OK: D2.4(I/O_3) J3.22
IDC_~{RST}: D1.4(I/O_3) J3.26
IDC_RS485.A: J3.10
IDC_RS485.B: J3.8
IDC_SENSE_N: J3.15 ; port SENSE_N  [project net BATT_SENSE_N]
IDC_SENSE_P: J3.13 ; port SENSE_P  [project net BATT_SENSE_P]
OK: R91.1 ; port OK
NetD2_3: D2.3(I/O_2) R91.2

Not connected (* = marked no-connect by the designer): D2 1(I/O_1) 6(I/O_4); J3 16 18 19 21 23

### Buses and harness runs
harness IDC_RS485 = port RS485

### Notes on the sheet
- Size:
- Date:
- A4
- Number:
- Time:
- Revision:
- Sheet
- of
- File:
- Author:

### Library data of the parts
C26 C27 = CMP-00100-3: as C28 on sheet SWD; ComponentLink1URL: https://datasheet.lcsc.com/szlcsc/Samsung-Electro-Mechanics-CL05C100JB5NNNC_C32949.pdf; LCSC Part Number: C28233; ComponentLink1Description: Datasheet; Tolerance: ±10%
D1 D2 = CMP-000039-5: as D3 on sheet SWD; RoHS Compliant: Yes; Min Operating Temperature: -40°C; ComponentLink1URL: https://www.st.com/resource/en/datasheet/usblc6-2.pdf; Case/Package: SOT-23-6; LCSC Part Number: C7519; ComponentLink1Description: Datasheet; Max Operating Temperature: 125°C
J3 = CMP-00118-2: Board Connector, 26 Contact(s), 2 Row(s), Male, Straight, 0.1 inch Pitch, Solder Kinked Leads Terminal, Locking, Red Insulator, Plug; LCSC Part Number: C19131003; ComponentLink2Description: Datasheet; ComponentLink1Description: Product Page; ComponentLink1URL: https://www.we-online.com/en/components/products/BTB_WR-MM_MINIMODULE_THT?sq=690367182672#690367182672; ComponentLink2URL: https://www.we-online.com/components/products/datasheet/690367182672.pdf
R91 = CMP-00128-3: as R76 on sheet RS485; ComponentLink1Description: Datasheet; Min Operating Temperature: -55°C; Manufacturer: Uniroyal; ComponentLink1URL: https://datasheet.lcsc.com/szlcsc/1811062009_UNI-ROYAL-Uniroyal-Elec-0603WAF1002T5E_C25804.pdf; Composition: Thick Film; LCSC Part Number: C23182; Max Operating Temperature: 155°C

## Sheet MLP.SchDoc: Modulated Load Perturbation
size A4; ApprovedBy: LD Stanton; Author: LD Stanton; CompanyName: University of Cape Town; DrawnBy: Lawrence Stanton; Engineer: Lawrence Stanton; Organization: University of Cape Town; Address1: Department of Electrical Engineering; Address2: Rondebosch; Address3: Cape Town; Address4: South Africa 7701; DocumentNumber: 10; SheetNumber: 10; SheetTotal: 14
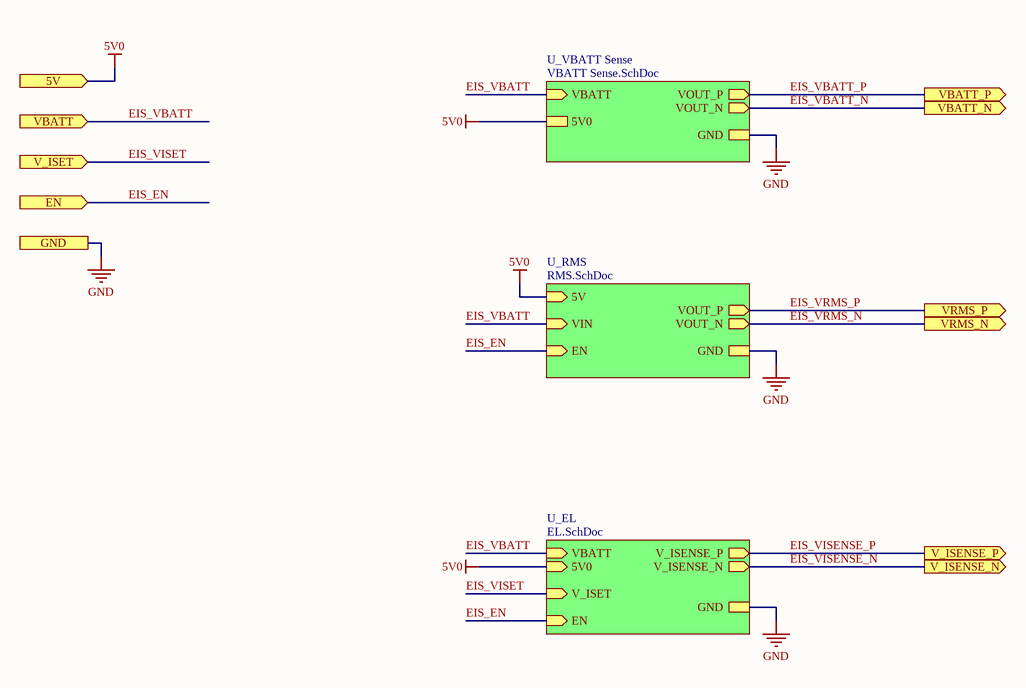
[diagram p6: MLP.SchDoc]

### Sub-sheets
U_EL = EL.SchDoc: GND, VBATT (in), V_ISET (in), 5V0 (in), V_ISENSE_P (out), EN (in), V_ISENSE_N (out)
U_RMS = RMS.SchDoc: 5V (in), GND, EN (in), VIN (in), VOUT_P (out), VOUT_N (out)
U_VBATT Sense = VBATT Sense.SchDoc: VBATT (in), VOUT_P (out), VOUT_N (out), GND, 5V0

### Ports
5V (in), EN (in), GND, V_ISENSE_N (out), V_ISENSE_P (out), V_ISET (in), VBATT (in), VBATT_N (out), VBATT_P (out), VRMS_N (out), VRMS_P (out)

### Nets
5V0: port 5V, sheet U_RMS/5V, sheet U_EL/5V0, sheet U_VBATT Sense/5V0  [project net 5V0A]
EIS_VBATT: port VBATT, sheet U_RMS/VIN, sheet U_EL/VBATT, sheet U_VBATT Sense/VBATT  [project net VBATT]
GND: port GND, sheet U_RMS/GND, sheet U_EL/GND, sheet U_VBATT Sense/GND
EIS_EN: port EN, sheet U_RMS/EN, sheet U_EL/EN
EIS_VBATT_N: port VBATT_N, sheet U_VBATT Sense/VOUT_N
EIS_VBATT_P: port VBATT_P, sheet U_VBATT Sense/VOUT_P
EIS_VISENSE_N: port V_ISENSE_N, sheet U_EL/V_ISENSE_N
EIS_VISENSE_P: port V_ISENSE_P, sheet U_EL/V_ISENSE_P
EIS_VISET: port V_ISET, sheet U_EL/V_ISET  [project net MCU_DAC]
EIS_VRMS_N: port VRMS_N, sheet U_RMS/VOUT_N
EIS_VRMS_P: port VRMS_P, sheet U_RMS/VOUT_P

### Notes on the sheet
- Size:
- Date:
- A4
- Number:
- Time:
- Revision:
- Sheet
- of
- File:
- Author:

## Sheet RMS.SchDoc: AC RMS to DC Converter
size A4; ApprovedBy: LD Stanton; Author: LD Stanton; CompanyName: University of Cape Town; DrawnBy: Lawrence Stanton; Engineer: Lawrence Stanton; Organization: University of Cape Town; Address1: Department of Electrical Engineering; Address2: Rondebosch; Address3: Cape Town; Address4: South Africa 7701; DocumentNumber: 12; SheetNumber: 12; SheetTotal: 14
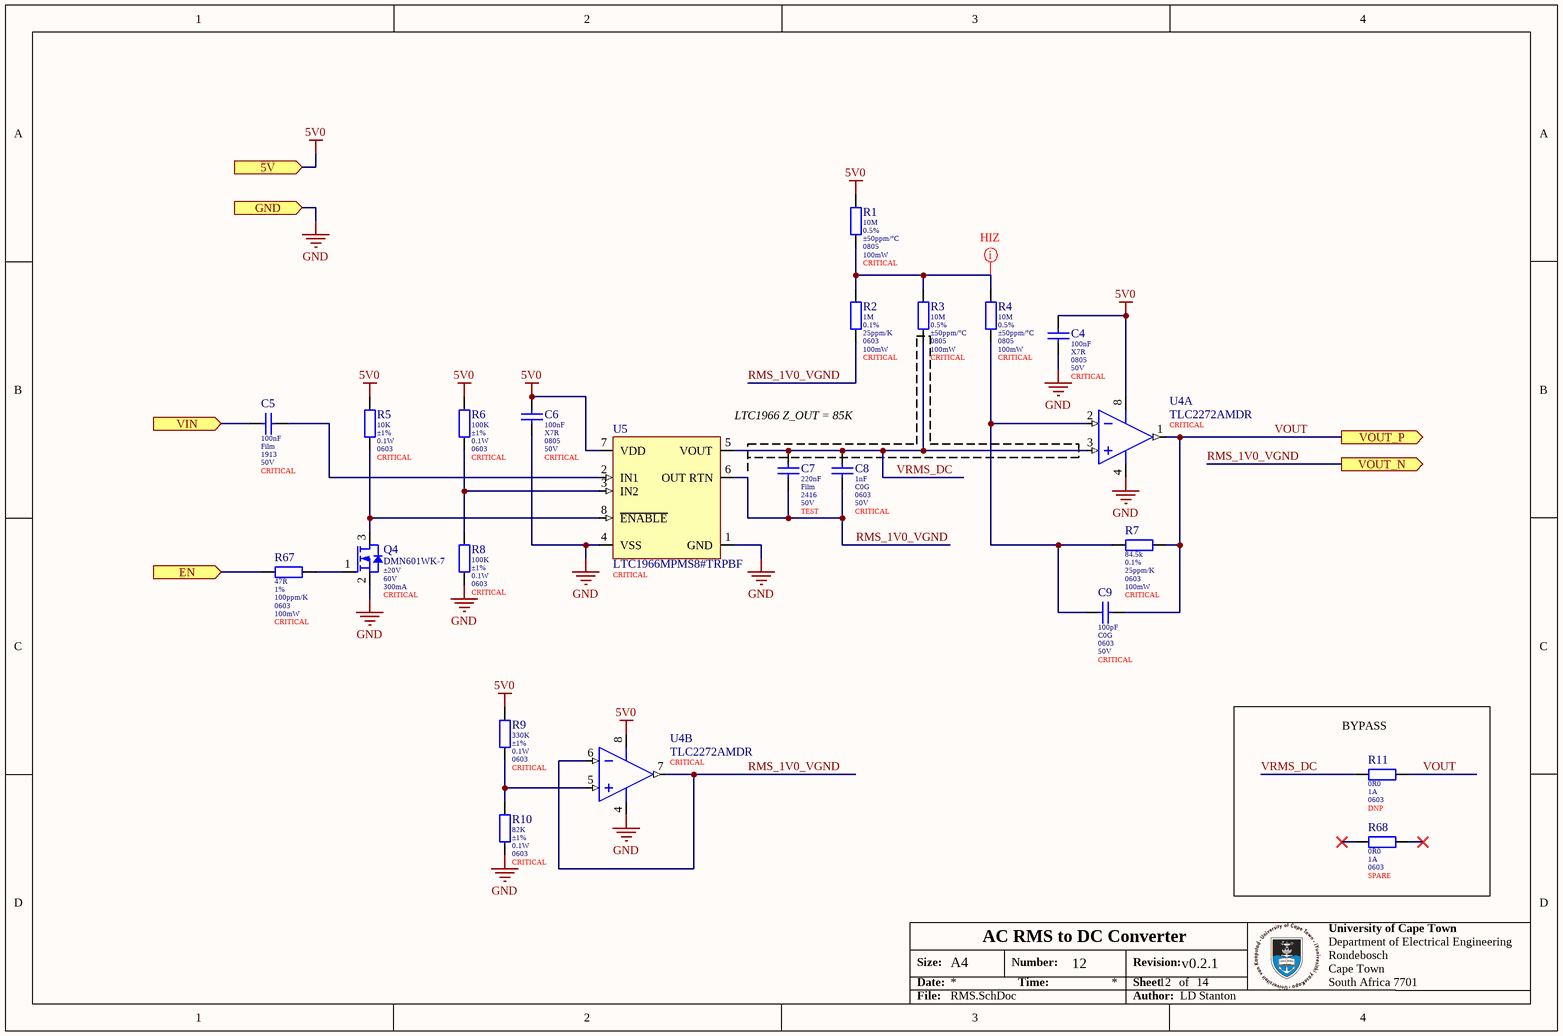
[diagram p7: RMS.SchDoc]

### Parts
C4  value 100nF  Dielectric: X7R  Package: 0805  Voltage: 50V  Populate: CRITICAL  [0805 (Yageo EA) B]  (hidden comment: CC0805KRX7R9BB104)
C5  value 100nF  Dielectric: Film  Package: 1913  Voltage: 50V  Populate: CRITICAL  [1913 (ECHU E2) B]  (hidden comment: ECHU1H104GX9)
C6  value 100nF  Dielectric: X7R  Package: 0805  Voltage: 50V  Populate: CRITICAL  [0805 (Yageo EA) B]  (hidden comment: CC0805KRX7R9BB104)
C7  value 220nF  Dielectric: Film  Package: 2416  Voltage: 50V  Populate: TEST  [2416 (Panasonic ECHU) B]  (hidden comment: ECH-U1H224GX9)
C8  value 1nF  Dielectric: C0G  Package: 0603  Voltage: 50V  Populate: CRITICAL  [0603_080_8 (Samsung) B]  (hidden comment: CL10C102JB8NNNC)
C9  value 100pF  Dielectric: C0G  Package: 0603  Voltage: 50V  Populate: CRITICAL  [0603_080_8 (Samsung) B]  (hidden comment: CL10C101JB8NNNC)
Q4  DMN601WK-7  Gate Source Voltage: ±20V  Drain Source Voltage: 60V  Continous Drain Current: 300mA  Placement: CRITICAL  [SOT323 (DMN601WK) B]
R1  value 10M  Tolerance: 0.5%  Temperature Coefficient: ±50ppm/°C  Package: 0805  Power: 100mW  Populate: CRITICAL  [0805 (Vishay DCRCW-P) A]  (hidden comment: CRCW080510M0DHEAP)
R2  value 1M  Tolerance: 0.1%  Temperature Coefficient: 25ppm/K  Package: 0603  Power: 100mW  Populate: CRITICAL  [0603 (Yageo RT) B]  (hidden comment: RT0603BRD071ML)
R3  value 10M  Tolerance: 0.5%  Temperature Coefficient: ±50ppm/°C  Package: 0805  Power: 100mW  Populate: CRITICAL  [0805 (Vishay DCRCW-P) A]  (hidden comment: CRCW080510M0DHEAP)
R4  value 10M  Tolerance: 0.5%  Temperature Coefficient: ±50ppm/°C  Package: 0805  Power: 100mW  Populate: CRITICAL  [0805 (Vishay DCRCW-P) A]  (hidden comment: CRCW080510M0DHEAP)
R5  value 10K  Tolerance: ±1%  Power: 0.1W  Package: 0603  Populate: CRITICAL  [0603 (Uniroyal) B]  (hidden comment: 0603WAF1002T5E)
R6  value 100K  Tolerance: ±1%  Power: 0.1W  Package: 0603  Populate: CRITICAL  [0603 (Uniroyal) B]  (hidden comment: 0603WAF1003T5E)
R7  value 84.5k  Tolerance: 0.1%  Temperature Coefficient: 25ppm/K  Package: 0603  Power: 100mW  Populate: CRITICAL  [0603 (Yageo RT) B]  (hidden comment: RT0603BRD0784K5L)
R8  value 100K  Tolerance: ±1%  Power: 0.1W  Package: 0603  Populate: CRITICAL  [0603 (Uniroyal) B]  (hidden comment: 0603WAF1003T5E)
R9  value 330K  Tolerance: ±1%  Power: 0.1W  Package: 0603  Populate: CRITICAL  [0603 (Uniroyal) B]  (hidden comment: 0603WAF3303T5E)
R10  value 82K  Tolerance: ±1%  Power: 0.1W  Package: 0603  Populate: CRITICAL  [0603 (Uniroyal) B]  (hidden comment: 0603WAF8202T5E)
R11  value 0R0  Current: 1A  Package: 0603  Populate: DNP  [0603 (Uniroyal) B]  (hidden comment: 0603WAF0000T5E)
R67  value 47R  Tolerance: 1%  Temperature Coefficient: 100ppm/K  Package: 0603  Power: 100mW  Populate: CRITICAL  [0603 (Uniroyal) B]  (hidden comment: 0603WAF470JT5E)
R68  value 0R0  Current: 1A  Package: 0603  Populate: SPARE  [0603 (Uniroyal) B]  (hidden comment: 0603WAF0000T5E)
U4  TLC2272AMDR  Placement: CRITICAL  [SOIC-8 (D008A) B]  (parts A,B of 2)
U5  LTC1966MPMS8#TRPBF  Placement: CRITICAL  [MSOP-8 (LTC1966) B]

### Blocks framed on the sheet
BYPASS: R11 R68

### Ports
5V (in), EN (in), GND (in), VIN (in), VOUT_N (out), VOUT_P (out)

### Nets
5V0: C4.2 C6.2 R1.1 R5.1 R6.1 R9.1 U4.8(VDD+) U5.7(VDD) ; port 5V  [project net 5V0A]
GND: C4.1 C6.1 Q4.2(S) R8.2 R10.2 U4.4(VDD-/GND) U5.1(GND) U5.4(VSS) ; port GND
VBATT: C5.1 ; port VIN
EIS_EN: R67.1 ; port EN
RMS_1V0_VGND: C7.2 C8.2 R2.1 U4.6(IN2-) U4.7(OUT2) U5.6(OUT_RTN) ; port VOUT_N  [project net EIS_VRMS_N]
VOUT: C9.2 R7.2 R11.2 U4.1(OUT1) ; port VOUT_P  [project net EIS_VRMS_P]
VRMS_DC: C7.1 C8.1 R3.2 R11.1 U4.3(IN1+) U5.5(VOUT)
NetC5_2: C5.2 U5.2(IN1)
NetC9_1: C9.1 R4.2 R7.1 U4.2(IN1-)
NetQ4_1: Q4.1(G) R67.2
NetQ4_3: Q4.3(D) R5.2 U5.8(~{ENABLE})
NetR1_2: R1.2 R2.2 R3.1 R4.1
NetR6_2: R6.2 R8.1 U5.3(IN2)
NetR9_2: R9.2 R10.1 U4.5(IN2+)

Not connected (* = marked no-connect by the designer): R68 1* 2*

### Layout directives
rule Clearance Constraint [Clearance = 0.5mm]; rule Solder Mask Expansion [Expansion = 7.874mil]: NetR1_2

### Notes on the sheet
- LTC1966 Z_OUT = 85K
- Size:
- Date:
- A4
- Number:
- Time:
- Revision:
- Sheet
- of
- File:
- Author:

### Library data of the parts
C4 C6 = CMP-047-000001-7: MLCC 100nF 50V 0805 X7R ±10%; Manufacturer: Yageo; ComponentLink1Description: Datasheet; ComponentLink1URL: https://datasheet.lcsc.com/szlcsc/YAGEO-CC0603KRX7R9BB104_C14663.pdf; Tolerance: ±10%; LCSC Part Number: C49678
C5 = CMP-001-00001-1: Film Capacitor, Polyphenylene Sulfide, 50V, 2% +Tol, 2% -Tol, 0.1uF, Surface Mount, 1913; ComponentLink1Description: Datasheet; Max Operating Temperature: 125°C; Tolerance: 2%; LCSC Part Number: C569828; ComponentLink1URL: https://jlcpcb.com/api/file/downloadByFileSystemAccessId/8588893398266204160; Min Operating Temperature: -55°C
C7 = CMP-001-00007-1: Film Capacitor, Polyphenylene Sulfide, 50V, 2% +Tol, 2% -Tol, 0.22uF, Surface Mount, 2416; LCSC Part Number: C569856; Min Operating Temperature: -55°C; ComponentLink1Description: Datasheet; Max Operating Temperature: 125°C; ComponentLink1URL: https://jlcpcb.com/api/file/downloadByFileSystemAccessId/8590903044286726144; Tolerance: 2%
C8 = CMP-00124-1: MLCC 1nF 0603 50V C0G ±5%; Manufacturer: Samsung; ComponentLink1URL: https://datasheet.lcsc.com/szlcsc/Samsung-Electro-Mechanics-CL05C100JB5NNNC_C32949.pdf; LCSC Part Number: C163508; Tolerance: 5%; Min Operating Temperature: -55°C; ComponentLink1Description: Datasheet; Max Operating Temperature: 125°C
C9 = CMP-045-000015-10: MLCC 100pF 0603 50V C0G ±0.1pF; Manufacturer: Samsung; ComponentLink1URL: https://datasheet.lcsc.com/szlcsc/Samsung-Electro-Mechanics-CL05C100JB5NNNC_C32949.pdf; ComponentLink1Description: Datasheet; Tolerance: ±0.1pF; LCSC Part Number: C14858
Q4 = CMP-00131-1: Mosfet, N-Ch, 60V, 0.3A, Sot-323 Rohs Compliant: Yes; Drain Source Resistance: 2; Polarity: N-Channel; Mode: Enhancement; LCSC Part Number: C151318; ComponentLink1URL: https://jlcpcb.com/api/file/downloadByFileSystemAccessId/8586203582969860096; Min Operating Temperature: -65°C; ComponentLink1Description: Datasheet; Max Operating Temperature: 150°C
R1 R3 R4 = CMP-009-00009-1: Resistor 10M 0805 ±0.5% Thick Film Vishay; Voltage Rating: 150V; Max Operating Temperature: 155°C; LCSC Part Number: C843972; Min Operating Temperature: -55°C; ComponentLink1Description: Datasheet; Manufacturer: Vishay; ComponentLink1URL: https://jlcpcb.com/api/file/downloadByFileSystemAccessId/8589808148883681280; Composition: Thick Film
R2 = CMP-00125-2: Resistor 1M0 0603 ±0.1% Thin Film Yaego; Voltage Rating: 75V; ComponentLink1Description: Datasheet; Manufacturer: Yaego; ComponentLink1URL: https://jlcpcb.com/api/file/downloadByFileSystemAccessId/8588919467732840449; Composition: Thin Film; Max Operating Temperature: 155°C; Min Operating Temperature: -55°C; LCSC Part Number: C326730
R5 = CMP-010-000293-9: Resistor 10K 0603 ±1% Thick Film Uniroyal; Working Voltage: 75V; Temperature Coefficient: ±100ppm/K; Temperature: -55 - 155°C; ComponentLink1URL: https://datasheet.lcsc.com/szlcsc/1811062009_UNI-ROYAL-Uniroyal-Elec-0603WAF1002T5E_C25804.pdf; LCSC Part Number: C25804; ComponentLink1Description: Datasheet; Pin Count: 2; Manufacturer: Uniroyal
R6 R8 = CMP-010-000288-10: as R97 on sheet MCU; LCSC Part Number: C25803; Temperature: -55 - 155°C; ComponentLink1URL: https://datasheet.lcsc.com/szlcsc/1811062009_UNI-ROYAL-Uniroyal-Elec-0603WAF1002T5E_C25804.pdf; Pin Count: 2; Manufacturer: Uniroyal; ComponentLink1Description: Datasheet
R7 = CMP-009-00002-1: Resistor 84K5 0603 ±0.1% Thin Film Yaego; Voltage Rating: 75V; LCSC Part Number: C705797; ComponentLink1URL: https://jlcpcb.com/api/file/downloadByFileSystemAccessId/8588919467732840449; ComponentLink1Description: Datasheet; Manufacturer: Yaego; Composition: Thin Film; Max Operating Temperature: 155°C; Min Operating Temperature: -55°C
R9 = CMP-010-000382-2: Resistor 330K 0603 ±1% Thick Film Uniroyal; Temperature Coefficient: ±100ppm/K; Working Voltage: 75V; LCSC Part Number: C23137; Manufacturer: Uniroyal; Temperature: -55 - 155°C; ComponentLink1URL: https://datasheet.lcsc.com/szlcsc/1811062009_UNI-ROYAL-Uniroyal-Elec-0603WAF1002T5E_C25804.pdf; ComponentLink1Description: Datasheet; Pin Count: 2
R10 = CMP-010-000347-9: Resistor 82K 0603 ±1% Thick Film Uniroyal; Temperature Coefficient: ±100ppm/K; Working Voltage: 75V; ComponentLink1URL: https://datasheet.lcsc.com/szlcsc/1811062009_UNI-ROYAL-Uniroyal-Elec-0603WAF1002T5E_C25804.pdf; LCSC Part Number: C23254; Pin Count: 2; Manufacturer: Uniroyal; ComponentLink1Description: Datasheet; Temperature: -55 - 155°C
R11 R68 = CMP-010-000359-7: Jumper 0603 1A Uniroyal; Pin Count: 2; ComponentLink1URL: https://datasheet.lcsc.com/szlcsc/1811062009_UNI-ROYAL-Uniroyal-Elec-0603WAF1002T5E_C25804.pdf; Manufacturer: Uniroyal; LCSC Part Number: C21189; Temperature: -55 - 155°C; ComponentLink1Description: Datasheet
R67 = CMP-00128-3: as R76 on sheet RS485; ComponentLink1Description: Datasheet; Min Operating Temperature: -55°C; Manufacturer: Uniroyal; ComponentLink1URL: https://datasheet.lcsc.com/szlcsc/1811062009_UNI-ROYAL-Uniroyal-Elec-0603WAF1002T5E_C25804.pdf; Composition: Thick Film; LCSC Part Number: C23182; Max Operating Temperature: 155°C
U4 = CMP-00126-1: Operational Amplifier, 2 Func, 1500uV Offset-Max, CMOS, PDSO8; Single Supply: Yes; Output Current: 50mA; Input Bias Current: 800pA; Input Offset Voltage: 1.5mV; Supply Max: 8V; Supply Min: -8V; Rail to Rail: Yes; ComponentLink1Description: Datasheet; Input Offset Current: 800pA; LCSC Part Number: C2878284; Min Operating Temperature: -55°C; Max Operating Temperature: 125°C; ComponentLink1URL: https://www.ti.com/lit/ds/symlink/tlc2272.pdf?ts=1754033641708&ref_url=https%253A%252F%252Fwww.ti.com%252Fproduct%252FTLC2272%253Futm_source%253Dgoogle%2526utm_medium%253Dcpc%2526utm_campaign%253Dasc-amps-null-44700045336317476_prodfolderdynamic-cpc-pf-go
U5 = CMP-00123-3: RMS to DC Converter, 1 Func, CMOS, PDSO8; Min Supply Voltage: 2.7V; Max Supply Voltage: 5.5V; ComponentLink1Description: Datasheet; Min Operating Temperature: -55°C; ComponentLink1URL: https://www.analog.com/media/en/technical-documentation/data-sheets/1966fb.pdf; LCSC Part Number: C679071; Max Operating Temperature: 125°C